# Altium schematic sheet Power.SchDoc
size 406 x 304 mm; SheetNumber: 2; SheetTotal: 7
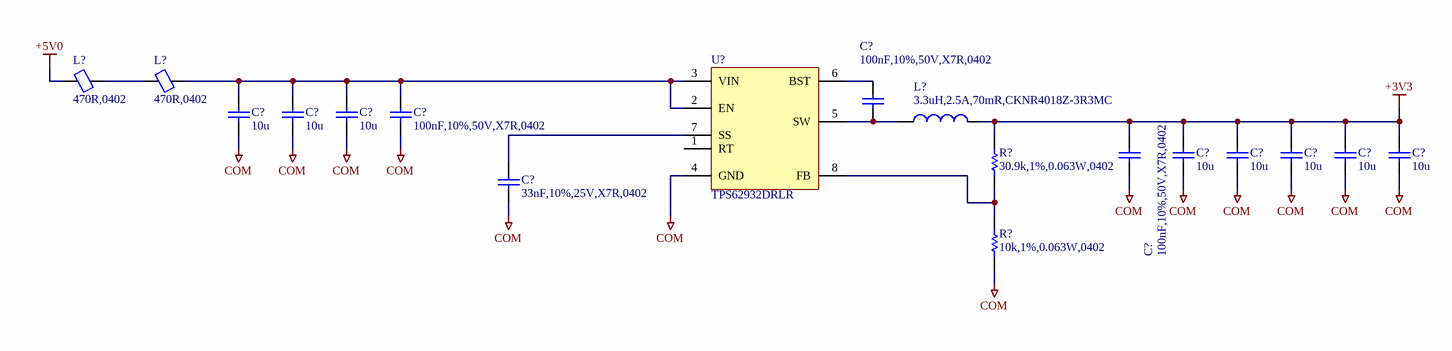
[diagram p0: Power.SchDoc]

## Parts
(Parts that share a designator on the sheet are numbered #1, #2 ... from top to bottom, then left to right.)
C?#1  100nF,10%,50V,X7R,0402  [CAPC1005X06N]
C?#2  10u  [CAPC1005X06N]
C?#3  10u  [CAPC1005X06N]
C?#4  10u  [CAPC1005X06N]
C?#5  100nF,10%,50V,X7R,0402  [CAPC1005X06N]
C?#6  100nF,10%,50V,X7R,0402  [CAPC1005X06N]
C?#7  10u  [CAPC1005X06N]
C?#8  10u  [CAPC1005X06N]
C?#9  10u  [CAPC1005X06N]
C?#10  10u  [CAPC1005X06N]
C?#11  10u  [CAPC1005X06N]
C?#12  33nF,10%,25V,X7R,0402  [CAPC1005X06N]
L?#1  470R,0402  [INDC1005X05N]
L?#2  470R,0402  [INDC1005X05N]
L?#3  3.3uH,2.5A,70mR,CKNR4018Z-3R3MC  [CHK_PKG_CKNR4018Z]
R?#1  30.9k,1%,0.063W,0402  [RESC1005X04N]
R?#2  10k,1%,0.063W,0402  [RESC1005X04N]
U?  TPS62932DRLR  [TEXASINSTRUMENTS_PKG_DRL0008A]

## Nets
+3V3: C?#6.2 C?#7.2 C?#8.2 C?#9.2 C?#10.2 C?#11.2 L?#3.2 R?#1.2
+5V0: L?#1.2
COM: C?#2.1 C?#3.1 C?#4.1 C?#5.1 C?#6.1 C?#7.1 C?#8.1 C?#9.1 C?#10.1 C?#11.1 C?#12.1 R?#2.1 U?.4(GND)
NetC?#1_1: C?#1.1 L?#3.1 U?.5(SW)
NetC?#1_2: C?#1.2 U?.6(BST)
NetC?#2_2: C?#2.2 C?#3.2 C?#4.2 C?#5.2 L?#2.1 U?.2(EN) U?.3(VIN)
NetC?#12_2: C?#12.2 U?.7(SS)
NetL?#1_1: L?#1.1 L?#2.2
NetR?#1_1: R?#1.1 R?#2.2 U?.8(FB)

Not connected (* = marked no-connect by the designer): U? 1(RT)

## Notes on the sheet
- Sheet Name:
- Date:
- Sheet
- Designer:
- of

## Library data of the parts
C?#1 C?#5 C?#6 = CAP,Cer,100nF,10%,50V,X7R,0402: 50V 100nF X7R Â±10% 0402 Ceramic Capacitors ROHS; Manufacturer 1: Murata; Manufacturer 1 Part Number: GRM155R71H104KE14D; Vendor 1 Part Number: C77020; Vendor 1: LCSC; Value: 100n; Part Name: CAP,Cer,100nF,10%,50V,X7R,0402; CreatedBy: Judd Foster; HelpURL: https://www.lcsc.com/datasheet/C77020.pdf
C?#2-C?#4 C?#7-C?#11 = CAP,Cer,10uF,10VDC,X5R,0402: 10 ï¿½F ï¿½20% 10V Ceramic Capacitor X5R 0402 (1005 Metric); Manufacturer 1: Samsung Electro-Mechanics; Manufacturer 1 Part Number: CL05A106MP5NUNC; Vendor 1 Part Number: 1276-1450-1-ND; Vendor 1: Digikey; Part Name: CAP,Cer,10uF,10VDC,X5R,0402; CreatedBy: Judd Foster; HelpURL: https://media.digikey.com/pdf/Data%20Sheets/Samsung%20PDFs/CL05A106MP5NUNC_Spec.pdf; Value: 10u
C?#12 = CAP,Cer,33nF,10%,25V,X7R,0402: 0.033 ÂµF Â±10% 25V Ceramic Capacitor X7R 0402 (1005 Metric); Manufacturer 1: Murata Electronics; Manufacturer 1 Part Number: GRM155R71E333KA88D; Vendor 1 Part Number: 490-3253-1-ND; Vendor 1: DigiKey; Value: 33n; Part Name: CAP,Cer,33nF,10%,25V,X7R,0402; CreatedBy: Judd Foster; HelpURL: https://search.murata.co.jp/Ceramy/image/img/A01X/G101/ENG/GRM155R71E333KA88-01.pdf
L?#1 L?#2 = Ferrite,470R@100MHz,0402: 470 Ohms @ 100 MHz 1 Power Line Ferrite Bead 0402 (1005 Metric) 1A 200mOhm; Manufacturer 1: Murata Electronics; Manufacturer 1 Part Number: BLM15PX471SN1D; Vendor 1 Part Number: 490-10662-1-ND; Vendor 1: Digikey; Value: 470; Part Name: Ferrite,470R@100MHz,0402; CreatedBy: Judd Foster; HelpURL: https://www.murata.com/en-us/products/productdata/8796740059166/ENFA0018.pdf
L?#3 = IND,3.3uH,2.5A,70mR,CKNR4018Z-3R3MC,4x4mm: 3.7A 3.3uH Â±20% 2.5A 70mÎ© Wire-wound inductor SMD,4x4mm Fixed Inductor; Manufacturer 1: CHK; Vendor 1 Part Number: C55454128; Vendor 1: LCSC; Value: 3.3u; Part Name: IND,3.3uH,2.5A,70mR,CKNR4018Z-3R3MC,4x4mm; CreatedBy: Kevin Heyer; HelpURL: https://www.lcsc.com/datasheet/C55454128.pdf; Manufacturer 1 Part Number: CKNR4018Z-3R3MC
R?#1 = RES,30.9k,1%,0.063W,0402: 30.9 kOhms Â±1% 0.063W, 1/16W Chip Resistor 0402 (1005 Metric) Automotive AEC-Q200 Thick Film; Manufacturer 1: Vishay Dale; Manufacturer 1 Part Number: CRCW040230K9FKED; Part Name: RES,30.9k,1%,0.063W,0402; CreatedBy: Kevin Heyer; HelpURL: https://www.vishay.com/docs/20035/dcrcwe3.pdf; Value: 30.9k
R?#2 = RES,10k,1%,0.063W,0402: RES 10K OHM 1% 1/16W 0402; Manufacturer 1: Vishay Dale; Manufacturer 1 Part Number: CRCW040210K0FKED; Part Name: RES,10k,1%,0.063W,0402; CreatedBy: Kevin Heyer; HelpURL: https://www.vishay.com/docs/20035/dcrcwe3.pdf; Value: 10k
U? = TPS62932DRLR: Buck Switching Regulator IC Positive Adjustable 0.8V 1 Output 2A SOT-583; Manufacturer 1: Texas Instruments; Vendor 1 Part Number: 296-TPS62932DRLRCT-ND; Vendor 1: DigiKey; Part Name: TPS62932DRLR; CreatedBy: Judd Foster; HelpURL: https://www.ti.com/lit/ds/symlink/tps62932.pdf?ts=1695814293505&ref_url=https%253A%252F%252Fwww.ti.com%252Fsitesearch%252Fen-us%252Fdocs%252Funiversalsearch.tsp%253FlangPref%253Den-US%2526searchTerm%253DTPS62932DRLR%2526nr%253D12%2526login-check%253Dtrue; Manufacturer 1 Part Number: TPS62932DRLR